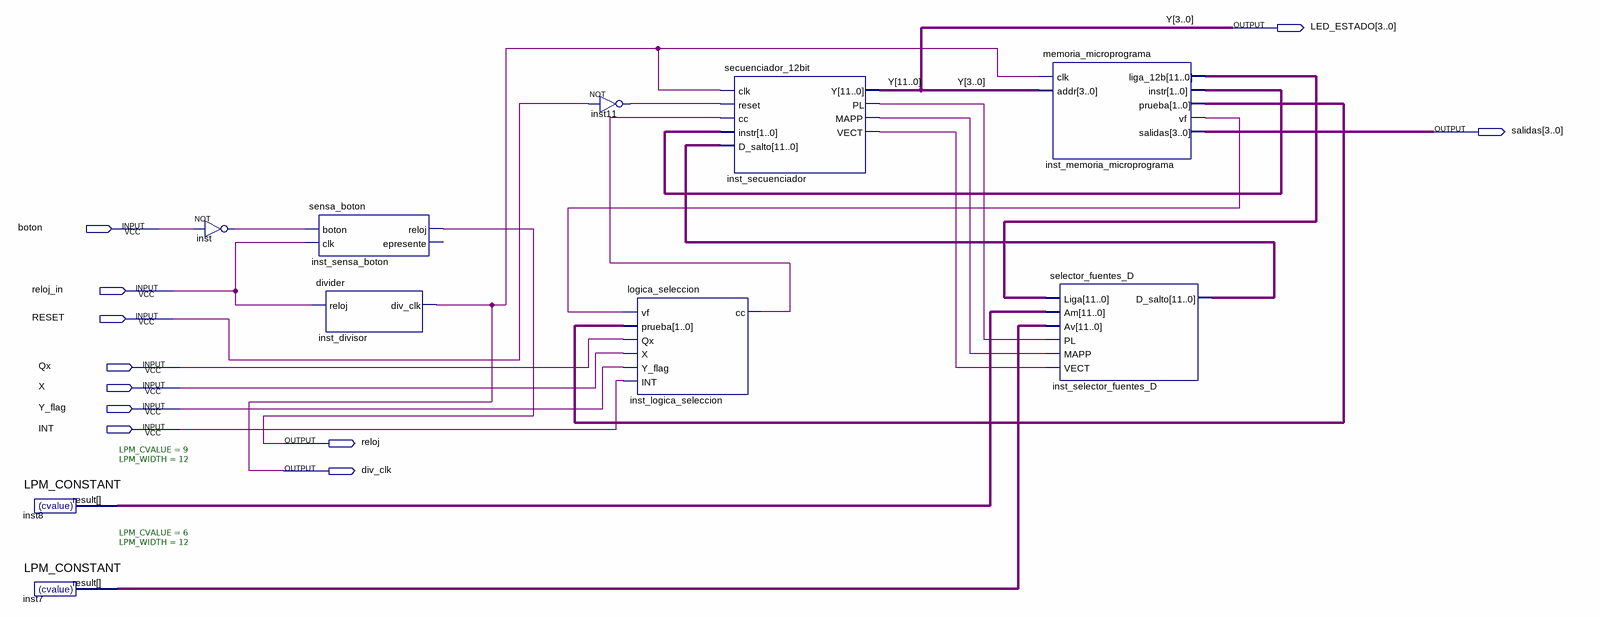
[diagram p0: schematic sheet]
// Quartus schematic practica_04.bdf as structural Verilog: 10 symbols, 11 pins
module practica_04 (
  input  boton,
  input  reloj_in,
  input  RESET,
  input  Qx,
  input  X,
  input  Y_flag,
  input  INT,
  output [3:0] LED_ESTADO,
  output [3:0] salidas,
  output reloj,
  output div_clk
);

  wire inst11_out, inst_logica_seleccion_cc, inst_memoria_microprograma_vf, inst_out, inst_secuenciador_mapp,
       inst_secuenciador_pl, inst_secuenciador_vect;
  wire [1:0] inst_memoria_microprograma_instr, inst_memoria_microprograma_prueba;
  wire [11:0] inst7_result, inst8_result, inst_memoria_microprograma_liga_12b,
       inst_selector_fuentes_D_d_salto;
  wire [11:4] Y;

  LPM_CONSTANT #(.LPM_CVALUE(9), .LPM_WIDTH(12)) inst8 (.result(inst8_result));
  LPM_CONSTANT #(.LPM_CVALUE(6), .LPM_WIDTH(12)) inst7 (.result(inst7_result));
  not inst (inst_out, boton);
  sensa_boton inst_sensa_boton (.boton(inst_out), .clk(reloj_in), .reloj(reloj));  // open: epresente
  divider inst_divisor (.reloj(reloj_in), .div_clk(div_clk));
  not inst11 (inst11_out, RESET);
  logica_seleccion inst_logica_seleccion (
    .vf(inst_memoria_microprograma_vf), .prueba(inst_memoria_microprograma_prueba), .Qx(Qx), .X(X),
    .Y_flag(Y_flag), .INT(INT), .cc(inst_logica_seleccion_cc));
  secuenciador_12bit inst_secuenciador (
    .clk(div_clk), .reset(inst11_out), .cc(inst_logica_seleccion_cc),
    .instr(inst_memoria_microprograma_instr), .D_salto(inst_selector_fuentes_D_d_salto), .Y({Y, LED_ESTADO}),
    .PL(inst_secuenciador_pl), .MAPP(inst_secuenciador_mapp), .VECT(inst_secuenciador_vect));
  memoria_microprograma inst_memoria_microprograma (
    .clk(div_clk), .addr(LED_ESTADO), .liga_12b(inst_memoria_microprograma_liga_12b),
    .instr(inst_memoria_microprograma_instr), .prueba(inst_memoria_microprograma_prueba),
    .vf(inst_memoria_microprograma_vf), .salidas(salidas));
  selector_fuentes_D inst_selector_fuentes_D (
    .Liga(inst_memoria_microprograma_liga_12b), .Am(inst8_result), .Av(inst7_result),
    .PL(inst_secuenciador_pl), .MAPP(inst_secuenciador_mapp), .VECT(inst_secuenciador_vect),
    .D_salto(inst_selector_fuentes_D_d_salto));

  // Other names for the same wires on the sheet: Y[3:0] = LED_ESTADO
endmodule
